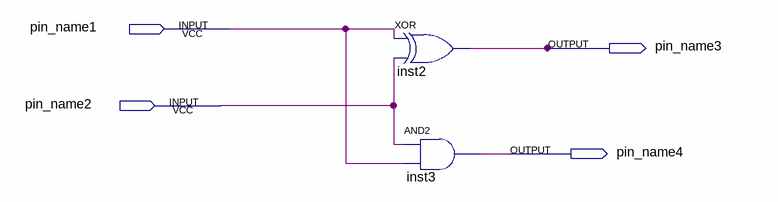
[diagram p0: schematic sheet]
// Quartus schematic ex4.bdf as structural Verilog: 2 symbols, 4 pins
module ex4 (
  input  pin_name1,
  input  pin_name2,
  output pin_name3,
  output pin_name4
);

  xor inst2 (pin_name3, pin_name1, pin_name2);
  and inst3 (pin_name4, pin_name2, pin_name1);
endmodule
